# Altium schematic sheet DEBUG_PORT_JTAG.SchDoc
size A
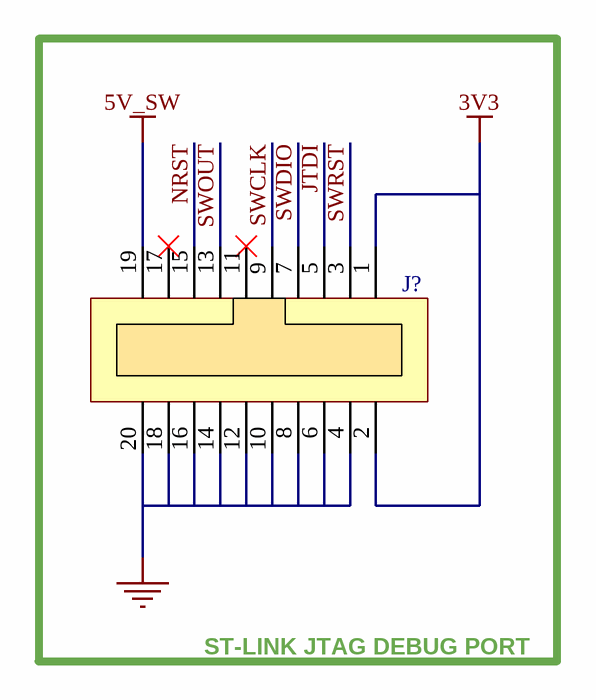
[diagram p0: DEBUG_PORT_JTAG.SchDoc]

## Parts
J?  CONN_JTAG  [MJB_61202021621]  (value not drawn)

## Blocks framed on the sheet
ST-LINK JTAG DEBUG PORT: J?

## Nets
3V3: J?.1 J?.2
5V_SW: J?.19
GND: J?.4 J?.6 J?.8 J?.10 J?.12 J?.14 J?.16 J?.18 J?.20
JTDI: J?.5
NRST: J?.15
SWCLK: J?.9
SWDIO: J?.7
SWOUT: J?.13
SWRST: J?.3

Not connected (* = marked no-connect by the designer): J? 11* 17*

## Library data of the parts
J? = CONN_JTAG: 20-pin JTAG connector